# Altium schematic sheet Teensy_4.1_Section.SchDoc
size 420 x 297 mm; SheetNumber: 2; SheetTotal: 4
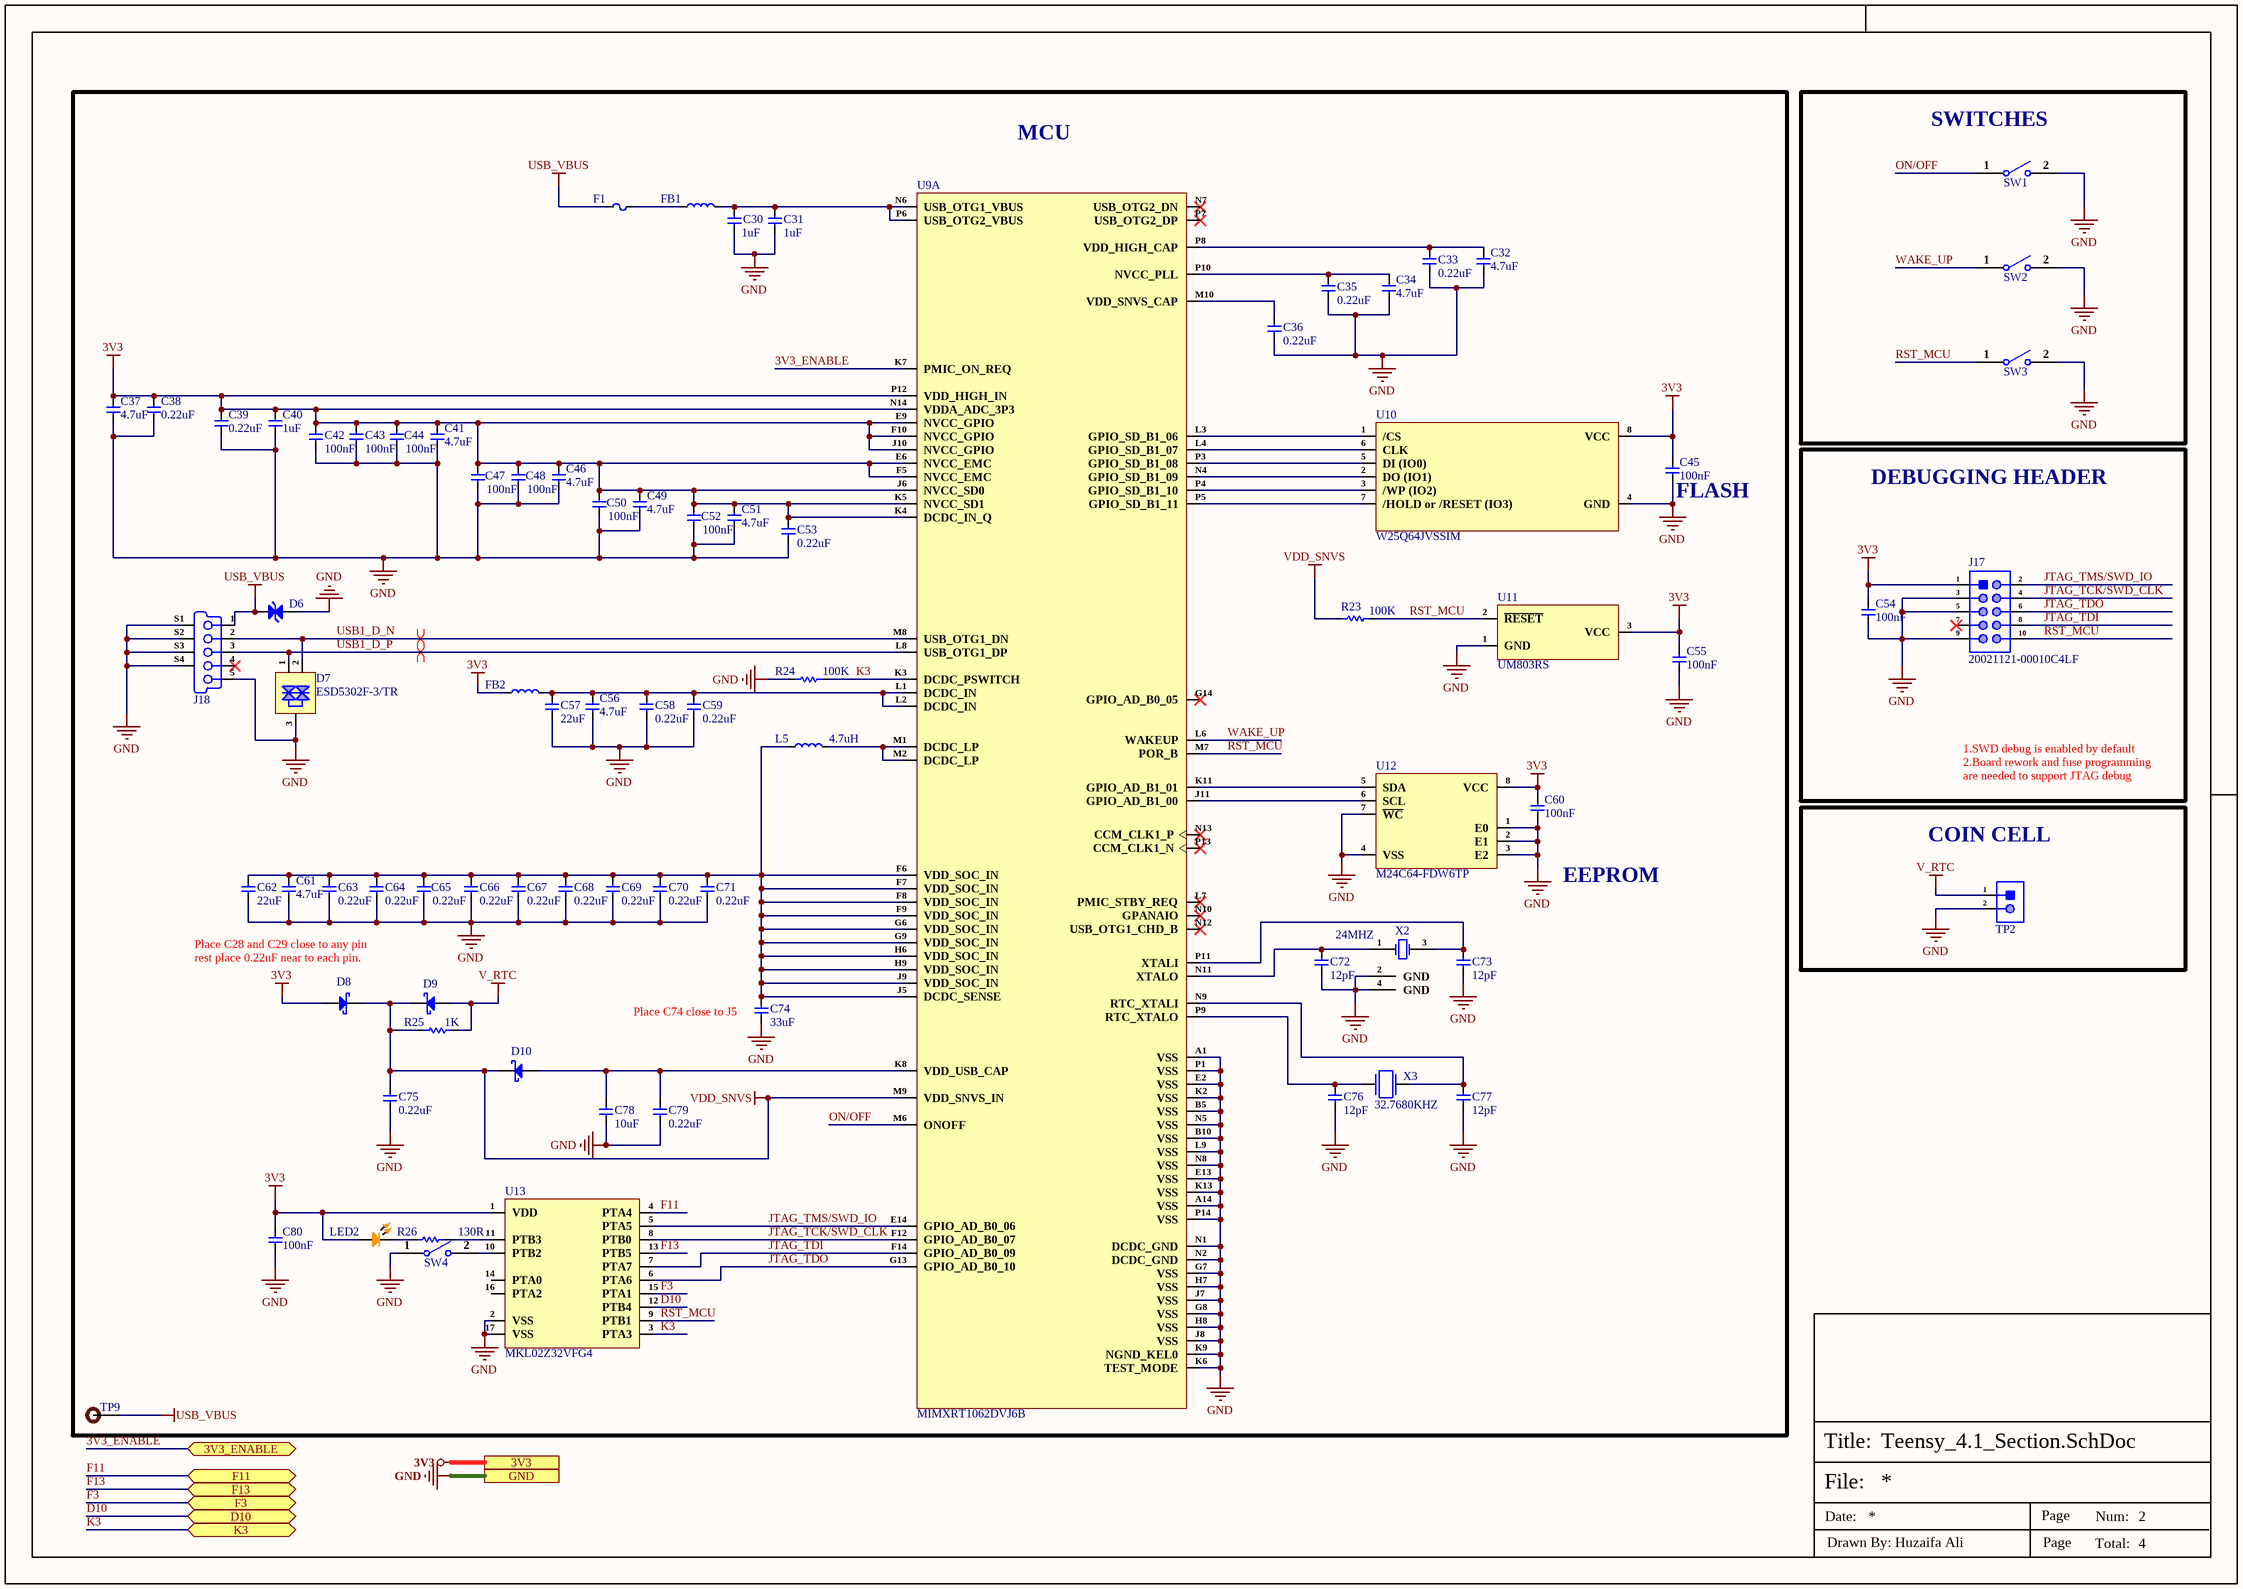
[diagram p0: Teensy_4.1_Section.SchDoc]

## Parts
C30  1uF  [Cap-0402]
C31  1uF  [Cap-0402]
C32  4.7uF  [Cap-0402]
C33  0.22uF  [Cap-0402]
C34  4.7uF  [Cap-0402]
C35  0.22uF  [Cap-0402]
C36  0.22uF  [Cap-0402]
C37  4.7uF  [Cap-0402]
C38  0.22uF  [Cap-0402]
C39  0.22uF  [Cap-0402]
C40  1uF  [Cap-0402]
C41  4.7uF  [Cap-0402]
C42  100nF  [cap-0402]
C43  100nF  [cap-0402]
C44  100nF  [cap-0402]
C45  100nF  [cap-0402]
C46  4.7uF  [Cap-0402]
C47  100nF  [cap-0402]
C48  100nF  [cap-0402]
C49  4.7uF  [Cap-0402]
C50  100nF  [cap-0402]
C51  4.7uF  [Cap-0402]
C52  100nF  [cap-0402]
C53  0.22uF  [Cap-0402]
C54  100nF  [cap-0402]
C55  100nF  [cap-0402]
C56  4.7uF  [Cap-0402]
C57  22uF  [Cap-0603]
C58  0.22uF  [Cap-0402]
C59  0.22uF  [Cap-0402]
C60  100nF  [cap-0402]
C61  4.7uF  [Cap-0402]
C62  22uF  [Cap-0603]
C63  0.22uF  [Cap-0402]
C64  0.22uF  [Cap-0402]
C65  0.22uF  [Cap-0402]
C66  0.22uF  [Cap-0402]
C67  0.22uF  [Cap-0402]
C68  0.22uF  [Cap-0402]
C69  0.22uF  [Cap-0402]
C70  0.22uF  [Cap-0402]
C71  0.22uF  [Cap-0402]
C72  12pF  [Cap-0402]
C73  12pF  [Cap-0402]
C74  33uF  [Cap-1206]
C75  0.22uF  [Cap-0402]
C76  12pF  [Cap-0402]
C77  12pF  [Cap-0402]
C78  10uF  [Cap-0603]
C79  0.22uF  [Cap-0402]
C80  100nF  [cap-0402]
D6  PESD5V0H1BSFYL  [DSN0603-2]  (value not drawn)
D7  ESD5302F-3/TR  [Sot-23]
D8  RB521S30T1G  [SOD-523]  (value not drawn)
D9  RB521S30T1G  [SOD-523]  (value not drawn)
D10  RB521S30T1G  [SOD-523]  (value not drawn)
F1  SMD0603-050  [Fuse-0603]  (value not drawn)
FB1  BLM15PD121SN1D  [IND-0402]  (value not drawn)
FB2  BLM15PD121SN1D  [IND-0402]  (value not drawn)
J17  20021121-00010C4LF  [20021121-00010C4LF_]
J18  HX MICRO XNJ JB  [HX MICRO XNJ JB]  (value not drawn)
L5  4.7uH  [IND-1210]
LED2  Orange  [LED-0805]  (value not drawn)
R23  100K  [Res-0402]
R24  100K  [Res-0402]
R25  1K  [Res-0603]
R26  130R  [Res-0603]
SW1  B3U-1000P  [B3U-1000P]  (value not drawn)
SW2  B3U-1000P  [B3U-1000P]  (value not drawn)
SW3  B3U-1000P  [B3U-1000P]  (value not drawn)
SW4  B3U-1000P  [B3U-1000P]  (value not drawn)
TP2  2 Test Pad  [2 Test Pad]  (value not drawn)  (no BOM)
TP9  TEST POINT  [Test-point]  (value not drawn)  (no BOM)
U9  MIMXRT1062DVJ6B  [196-LFBGA (12x12)]  (part A of 2)
U10  W25Q64JVSSIM  [SOIC-8 (208 mil)]
U11  UM803RS  [SOT-23]
U12  M24C64-FDW6TP  [8-TSSOP]
U13  MKL02Z32VFG4  [16-QFN (3x3).]
X2  24MHZ  [X322524MOB4SI-]
X3  32.7680KHZ  [NX3215SA-32.768K-STD-MUA-8_]

## Blocks framed on the sheet
SWITCHES: SW1-SW3
DEBUGGING HEADER: C54 J17
COIN CELL: TP2

## Ports
3V3 (see Top_Section[4B], Controller_Section[5D], Power_Section[1D]), 3V3_ENABLE (bidir, see Top_Section[4B], Power_Section[1D]), D10 (bidir, see Top_Section[4B], Controller_Section[4D]), F3 (bidir, see Top_Section[4B], Controller_Section[4D]), F11 (bidir, see Top_Section[4B], Controller_Section[4D]), F13 (bidir, see Top_Section[4B], Controller_Section[4D]), GND (see Top_Section[4B], Controller_Section[5D], Power_Section[1D]), K3 (bidir, see Top_Section[4B], Controller_Section[4D])

## Nets
3V3: C37.2 C38.2 C39.2 C40.2 C41.2 C42.2 C43.2 C44.2 C45.2 C46.2 C47.2 C48.2 C49.2 C50.2 C51.2 C52.2 C53.2 C54.2 C55.2 C60.2 C80.2 D8.1(A) FB2.1 J17.1 LED2.1 U9.E6(NVCC_EMC) U9.E9(NVCC_GPIO) U9.F5(NVCC_EMC) U9.F10(NVCC_GPIO) U9.J6(NVCC_SD0) U9.J10(NVCC_GPIO) U9.K4(DCDC_IN_Q) U9.K5(NVCC_SD1) U9.N14(VDDA_ADC_3P3) U9.P12(VDD_HIGH_IN) U10.8(VCC) U11.3(VCC) U12.8(VCC) U13.1(VDD) ; port 3V3
GND: C30.1 C31.1 C32.1 C33.1 C34.1 C35.1 C36.1 C37.1 C38.1 C39.1 C40.1 C41.1 C42.1 C43.1 C44.1 C45.1 C46.1 C47.1 C48.1 C49.1 C50.1 C51.1 C52.1 C53.1 C54.1 C55.1 C56.1 C57.1 C58.1 C59.1 C60.1 C61.1 C62.1 C63.1 C64.1 C65.1 C66.1 C67.1 C68.1 C69.1 C70.1 C71.1 C72.2 C73.2 C74.1 C75.1 C76.2 C77.2 C78.1 C79.1 C80.1 D6.1(A) D7.3(GND) J17.3 J17.5 J17.9 J18.5(GND) J18.S1(Shield) J18.S2(Shield) J18.S3(Shield) J18.S4(Shield) R24.1 SW1.2 SW2.2 SW3.2 SW4.1 TP2.2 U9.A1(VSS) U9.A14(VSS) U9.B5(VSS) U9.B10(VSS) U9.E2(VSS) U9.E13(VSS) U9.G7(VSS) U9.G8(VSS) U9.H7(VSS) U9.H8(VSS) U9.J7(VSS) U9.J8(VSS) U9.K2(VSS) U9.K6(TEST_MODE) U9.K9(NGND_KEL0) U9.K13(VSS) U9.L9(VSS) U9.N1(DCDC_GND) U9.N2(DCDC_GND) U9.N5(VSS) U9.N8(VSS) U9.P1(VSS) U9.P14(VSS) U10.4(GND) U11.1(GND) U12.1(E0) U12.2(E1) U12.3(E2) U12.4(VSS) U12.7(~{WC}) U13.2(VSS) U13.17(VSS) X2.2(GND) X2.4(GND) ; port GND
USB_VBUS: D6.2(A) F1.1 J18.1(V_BUS_(5V)) TP9.1
V_RTC: D9.1(A) R25.1 TP2.1
VDD_SNVS: C75.2 D8.2(K) D9.2(K) D10.2(K) R23.1 R25.2 U9.M9(VDD_SNVS_IN)
3V3_ENABLE: U9.K7(PMIC_ON_REQ) ; port 3V3_ENABLE
D10: U13.12(PTB4) ; port D10
F3: U13.15(PTA1) ; port F3
F11: U13.4(PTA4) ; port F11
F13: U13.13(PTB5) ; port F13
JTAG_TCK/SWD_CLK: J17.4 U9.F12(GPIO_AD_B0_07) U13.8(PTB0)
JTAG_TDI: J17.8 U9.F14(GPIO_AD_B0_09) U13.7(PTA7)
JTAG_TDO: J17.6 U9.G13(GPIO_AD_B0_10) U13.6(PTA6)
JTAG_TMS/SWD_IO: J17.2 U9.E14(GPIO_AD_B0_06) U13.5(PTA5)
K3: R24.2 U9.K3(DCDC_PSWITCH) U13.3(PTA3) ; port K3
ON/OFF: SW1.1 U9.M6(ONOFF)
RST_MCU: J17.10 R23.2 SW3.1 U9.M7(POR_B) U11.2(~{RESET}) U13.9(PTB1)
USB1_D_N: D7.2(I/O2) J18.2(D-) U9.M8(USB_OTG1_DN)
USB1_D_P: D7.1(I/O1) J18.3(D+) U9.L8(USB_OTG1_DP)
WAKE_UP: SW2.1 U9.L6(WAKEUP)
NetC30_2: C30.2 C31.2 FB1.2 U9.N6(USB_OTG1_VBUS) U9.P6(USB_OTG2_VBUS)
NetC32_2: C32.2 C33.2 U9.P8(VDD_HIGH_CAP)
NetC34_2: C34.2 C35.2 U9.P10(NVCC_PLL)
NetC36_2: C36.2 U9.M10(VDD_SNVS_CAP)
NetC56_2: C56.2 C57.2 C58.2 C59.2 FB2.2 U9.L1(DCDC_IN) U9.L2(DCDC_IN)
NetC61_2: C61.2 C62.2 C63.2 C64.2 C65.2 C66.2 C67.2 C68.2 C69.2 C70.2 C71.2 C74.2 L5.1 U9.F6(VDD_SOC_IN) U9.F7(VDD_SOC_IN) U9.F8(VDD_SOC_IN) U9.F9(VDD_SOC_IN) U9.G6(VDD_SOC_IN) U9.G9(VDD_SOC_IN) U9.H6(VDD_SOC_IN) U9.H9(VDD_SOC_IN) U9.J5(DCDC_SENSE) U9.J9(VDD_SOC_IN)
NetC72_1: C72.1 U9.N11(XTALO) X2.1(CRYSTAL)
NetC73_1: C73.1 U9.P11(XTALI) X2.3(CRYSTAL)
NetC76_1: C76.1 U9.P9(RTC_XTALO) X3.2
NetC77_1: C77.1 U9.N9(RTC_XTALI) X3.1
NetC78_2: C78.2 C79.2 D10.1(A) U9.K8(VDD_USB_CAP)
NetF1_2: F1.2 FB1.1
NetL5_2: L5.2 U9.M1(DCDC_LP) U9.M2(DCDC_LP)
NetLED2_2: LED2.2 R26.2
NetR26_1: R26.1 U13.11(PTB3)
NetSW4_2: SW4.2 U13.10(PTB2)
NetU9_J11: U9.J11(GPIO_AD_B1_00) U12.6(SCL)
NetU9_K11: U9.K11(GPIO_AD_B1_01) U12.5(SDA)
NetU9_L3: U9.L3(GPIO_SD_B1_06) U10.1(/CS)
NetU9_L4: U9.L4(GPIO_SD_B1_07) U10.6(CLK)
NetU9_N4: U9.N4(GPIO_SD_B1_09) U10.2(DO_(IO1))
NetU9_P3: U9.P3(GPIO_SD_B1_08) U10.5(DI_(IO0))
NetU9_P4: U9.P4(GPIO_SD_B1_10) U10.3(/WP_(IO2))
NetU9_P5: U9.P5(GPIO_SD_B1_11) U10.7(/HOLD_or_/RESET_(IO3))

Not connected (* = marked no-connect by the designer): J17 7*; J18 4(ID)*; U9 G14(GPIO_AD_B0_05)* L7(PMIC_STBY_REQ)* N7(USB_OTG2_DN)* N10(GPANAIO)* N12(USB_OTG1_CHD_B)* N13(CCM_CLK1_P)* P7(USB_OTG2_DP)* P13(CCM_CLK1_N)*; U13 14(PTA0) 16(PTA2)

## Layout directives
differential pair; net class USB_PROGRAM; differential pair class USB_PROGRAM_Lines; rule Impedance Constraint [Min = 85.00    Max = 90.00    ]; rule Matched Net Lengths [Tolerance = 50mil]: USB1_D_N, USB1_D_P

## Notes on the sheet
- MCU
- (near C45) FLASH
- 1.SWD debug is enabled by default
  2.Board rework and fuse programming
  are needed to support JTAG debug
- EEPROM
- Place C28 and C29 close to any pin rest place 0.22uF near to each pin.
- (near C74) Place C74 close to J5
- File:
- Title:
- Date:
- Page
- Num:
- Total:
- Drawn By: Huzaifa Ali

## Library data of the parts
C30 C31 C40 = CC0402KRX5R7BB105: CAP CER 1UF 16V X5R 0402; Manufacturer: Yageo; Tolerance: 10%; Item Type: Capacitor; Supplier 1: Digi-Key; Manufacturer Part Number: CC0402KRX5R7BB105; Stock 1: 1405667; Pricing 1: 1=0.36, 10=0.252, 100=0.1512, 500=0.1134, 1000=0.09576, 2500=0.09072, 5000=0.08568 (USD); Mount: Surface Mount; Case/Package: 0402; Weight: 2.3E-05oz; Case Code (Imperial): 0402; Case Code (Metric): 1005; Min Operating Temperature: -55°C; Max Operating Temperature: 85°C; Capacitance: 1uF; Dielectric: X5R; Packaging: Tape and Reel; Voltage Rating (DC): 16V; Voltage Rating: 16V; Termination: SMD/SMT; Composition: Ceramic; Length: 1mm; Height: 0.5mm; Width: 0.02inch; Thickness: 0.022inch; Depth: 0.5mm; Radiation Hardening: No; Lead Free: Lead Free; Halogen Free: Halogen Free; ComponentLink1URL: http://www.yageo.com/documents/recent/UPY-GPHC_X5R_4V-to-50V_12.pdf?src-supplier=Avnet+Europe; ComponentLink1Description: http://www.yageo.com/documents/recent/UPY-GPHC_X5R_4V-to-50V_12.pdf?src-supplier=Avnet+Europe; Supplier Part Number 1: 311-1691-6-ND; LCSC Part Number: C325464
C32 C34 C37 C41 C46 C49 C51 C56 C61 = CGA0402X5R475M250GT: 25V 4.7uF X5R ±20% 0402 Multilayer Ceramic Capacitors MLCC - SMD/SMT ROHS; Manufacturer: HRE; ComponentLink1Description: LCSC; ComponentLink1URL: https://www.lcsc.com/product-detail/Multilayer-Ceramic-Capacitors-MLCC-SMD-SMT_HRE-CGA0402X5R475M250GT_C6119795.html; Manufacturer Part Number: CGA0402X5R475M250GT; Footprint: 0402; Value: 4.7uF; LCSC Part Number: C6119795; Item Type: Capacitor
C33 C35 C36 C38 C39 C53 C58 C59 C63-C71 C75 C79 = CC0402KRX5R8BB224: CAP CER 0.22UF 25V X5R 0402; Manufacturer: Yageo; Capacitance: 220nF; Tolerance: 10%; Supplier 1: Mouser; Manufacturer Part Number: CC0402KRX5R8BB224; RoHS: Yes; Category: Ceramic Capacitors; Stock 1: 61266; Pricing 1: 1=0.10000, 10=0.03300, 50=0.03300, 100=0.02700, 1000=0.01500, 10000=0.01300 (USD); Mount: Surface Mount; Case/Package: 0402; Min Operating Temperature: -55°C; Max Operating Temperature: 85°C; Packaging: Tape and Reel; Voltage Rating: 25V; Voltage Rating (DC): 25V; Dielectric: X5R; Length: 0.039inch; Width: 0.02inch; Thickness: 0.022inch; Lead Free: Lead Free; Halogen Free: Halogen Free; RoHS Compliant: Yes; ComponentLink1URL: http://www.yageo.com/documents/recent/UPY-GPHC_X5R_4V-to-50V_25.pdf?src-supplier=Digi-Key; ComponentLink1Description: http://www.yageo.com/documents/recent/UPY-GPHC_X5R_4V-to-50V_25.pdf?src-supplier=Digi-Key; ComponentLink2URL: https://www.yageo.com/upload/media/product/productsearch/datasheet/mlcc/UPY-GPHC_X5R_4V-to-50V_26.pdf?src-supplier=Digi-Key; ComponentLink2Description: https://www.yageo.com/upload/media/product/productsearch/datasheet/mlcc/UPY-GPHC_X5R_4V-to-50V_26.pdf?src-supplier=Digi-Key; ComponentLink3URL: http://www.yageo.com/documents/recent/UPY-GPHC_X5R_4V-to-50V_23.pdf?src-supplier=Digi-Key; ComponentLink3Description: http://www.yageo.com/documents/recent/UPY-GPHC_X5R_4V-to-50V_23.pdf?src-supplier=Digi-Key; Supplier Part Number 1: 603-CC402KRX5R8BB224; LCSC Part Number: C326836
C42-C45 C47 C48 C50 C52 C54 C55 C60 C80 = C1005X7R1H104KT000F: CAP CER 0.1UF 50V X7R 0402; Manufacturer: TDK; Tolerance: 10%; Voltage: 25V; Item Type: Capacitor; Supplier 1: Avnet; Manufacturer Part Number: C1005X7R1H104KT000F; RoHS: No; Category: Ceramic Capacitors; Dielectric: X7R; Supplier Part Number 1: C1005X7R1H104KT000F; LCSC Part Number: C361198; ComponentLink1Description: LCSC; ComponentLink1URL: https://www.lcsc.com/product-detail/Multilayer-Ceramic-Capacitors-MLCC-SMD-SMT_TDK-C1005X7R1H104KT000F_C361198.html
C57 C62 = CC0603MRX5R6BB226: CAP CER 22UF 10V X5R 0603; Manufacturer: Yageo; Tolerance: 20%; Item Type: Capacitor; Supplier 1: Digi-Key; Manufacturer Part Number: CC0603MRX5R6BB226; RoHS: Yes; Category: Ceramic Capacitors; Stock 1: 19628; Pricing 1: 1=0.68000, 10=0.48000, 50=0.36300, 100=0.31610, 500=0.23416, 1000=0.19903 (USD); Mount: Surface Mount; Case/Package: 0603; Case Code (Metric): 1608; Case Code (Imperial): 0603; Weight: 7.1E-05oz; Min Operating Temperature: -55°C; Max Operating Temperature: 85°C; Packaging: Tape and Reel; Capacitance: 22uF; Voltage Rating: 10V; Dielectric: X5R; Termination: SMD/SMT; Voltage Rating (DC): 10V; Package Quantity: 4000; Length: 0.063inch; Width: 0.8mm; Height: 0.8mm; Thickness: 0.035inch; Lead Free: Lead Free; Halogen Free: Halogen Free; RoHS Compliant: Yes; ComponentLink1URL: http://www.mouser.com/ds/2/447/Yageo_UPY-GP_NP0_16V-to-50V_9-358835.pdf?src-supplier=Mouser; ComponentLink1Description: http://www.mouser.com/ds/2/447/Yageo_UPY-GP_NP0_16V-to-50V_9-358835.pdf?src-supplier=Mouser; ComponentLink2URL: http://www.yageo.com/documents/recent/UPY-GPHC_X5R_4V-to-50V_25.pdf?src-supplier=Digi-Key; ComponentLink2Description: http://www.yageo.com/documents/recent/UPY-GPHC_X5R_4V-to-50V_25.pdf?src-supplier=Digi-Key; Supplier Part Number 1: 311-1819-1-ND; LCSC Part Number: C109447
C72 C73 C76 C77 = GJM1555C1H120GB01D: CAP CER 12PF 50V C0G/NP0 0402; Manufacturer: Murata; Tolerance: 2%; Dielectric: C0G; Supplier 1: Digi-Key; Manufacturer Part Number: GJM1555C1H120GB01D; RoHS: Yes; Category: Ceramic Capacitors; Stock 1: 266975; Pricing 1: 1=0.18000, 10=0.12600, 50=0.07560, 100=0.06390, 500=0.04370, 1000=0.03865, 2500=0.03698, 5000=0.03361 (USD); Mount: Surface Mount; Case/Package: 0402; Case Code (Imperial): 0402; Case Code (Metric): 1005; Min Operating Temperature: -55°C; Max Operating Temperature: 125°C; Capacitance: 12pF; Voltage Rating: 50V; Voltage Rating (DC): 50V; Packaging: Tape and Reel; Package Quantity: 10000; Termination: SMD/SMT; Series: GJM; Construction: Flat; Length: 1mm; Width: 0.5mm; Height: 0.5mm; Thickness: 0.022inch; Depth: 0.5mm; Radiation Hardening: No; Lead Free: Lead Free; RoHS Compliant: Yes; ComponentLink1URL: https://datasheet.ciiva.com/11608/product-11608208.pdf?src-supplier=Avnet; ComponentLink1Description: https://datasheet.ciiva.com/11608/product-11608208.pdf?src-supplier=Avnet; ComponentLink2URL: https://datasheet.ciiva.com/29542/partnumbering-e-01-29542716.pdf?src-supplier=Digi-Key; ComponentLink2Description: https://datasheet.ciiva.com/29542/partnumbering-e-01-29542716.pdf?src-supplier=Digi-Key; ComponentLink3URL: https://datasheet.ciiva.com/29542/partnumbering-e-01-29542715.pdf?src-supplier=Digi-Key; ComponentLink3Description: https://datasheet.ciiva.com/29542/partnumbering-e-01-29542715.pdf?src-supplier=Digi-Key; ComponentLink4URL: https://datasheet.ciiva.com/29542/partnumbering-e-01-29542717.pdf?src-supplier=Digi-Key; ComponentLink4Description: https://datasheet.ciiva.com/29542/partnumbering-e-01-29542717.pdf?src-supplier=Digi-Key; Supplier Part Number 1: 490-8078-1-ND; LCSC Part Number: C161305
C74 = C3216X5R1A336MTJ00N: 10V 33uF X5R ±20% 1206 ROHS; Manufacturer: TDK; Item Type: Capacitor; ComponentLink1URL: https://datasheet.ciiva.com/24216/c3216x5r1a336m160ab-264972-24216176.pdf?src-supplier=Mouser; ComponentLink1Description: https://datasheet.ciiva.com/24216/c3216x5r1a336m160ab-264972-24216176.pdf?src-supplier=Mouser; ComponentLink2URL: https://datasheet.ciiva.com/16482/mlccspec-commercial-general-midvoltage-en-16482550.pdf?src-supplier=Future+Electronics; ComponentLink2Description: https://datasheet.ciiva.com/16482/mlccspec-commercial-general-midvoltage-en-16482550.pdf?src-supplier=Future+Electronics; ComponentLink3URL: https://datasheet.ciiva.com/6253/tdkmlcccaprange-6253132.pdf?src-supplier=Digi-Key; ComponentLink3Description: https://datasheet.ciiva.com/6253/tdkmlcccaprange-6253132.pdf?src-supplier=Digi-Key; ComponentLink4URL: https://datasheet.ciiva.com/6253/tdkmlcccaprange-6253134.pdf?src-supplier=Digi-Key; ComponentLink4Description: https://datasheet.ciiva.com/6253/tdkmlcccaprange-6253134.pdf?src-supplier=Digi-Key; LCSC Part Number: C342606; Manufacturer Part Number: C3216X5R1A336MTJ00N; Package: 1206
C78 = CL10A106MA8NRNC: CAP CER 10UF 25V X5R 0603; Manufacturer: Samsung; Tolerance: 20%; Supplier 1: Avnet; Manufacturer Part Number: CL10A106MA8NRNC; RoHS: Yes; Category: Ceramic Capacitors; Pricing 1: 4000=0.03753, 8000=0.03700, 16000=0.03595, 24000=0.03515, 32000=0.03383, 40000=0.03304, 400000=0.03225 (USD); Mount: Surface Mount; Case/Package: 0603; Case Code (Metric): 1608; Case Code (Imperial): 0603; Contact Plating: Tin; Min Operating Temperature: -55°C; Max Operating Temperature: 85°C; Package Quantity: 1; Packaging: Tape and Reel; Capacitance: 10uF; Voltage Rating: 25V; Dielectric: X5R; Termination: Wraparound; Series: CL; Construction: Flat; Length: 0.063inch; Width: 0.031inch; Thickness: 0.035inch; Lead Free: Lead Free; RoHS Compliant: Yes; ComponentLink1URL: https://datasheet.ciiva.com/25766/cl10a106ma8nrnc-25766562.pdf?src-supplier=Digi-Key; ComponentLink1Description: https://datasheet.ciiva.com/25766/cl10a106ma8nrnc-25766562.pdf?src-supplier=Digi-Key; Supplier Part Number 1: CL10A106MA8NRNC; LCSC Part Number: C96446
D6 = PESD5V0H1BSFYL: TVS DIODE 5VWM 6.3VC DSN0603-2; Manufacturer: Nexperia; Supplier 1: Avnet; Manufacturer Part Number: PESD5V0H1BSFYL; RoHS: Yes; Category: ESD and Circuit Protection ICs; Stock 1: 9000; Pricing 1: 18000=0.06453, 36000=0.06278, 54000=0.06104, 90000=0.05930, 180000=0.05755, 900000=0.05581, 1800000=0.05406 (USD); RoHS Compliant: Yes; ComponentLink1URL: http://www.farnell.com/datasheets/1961312.pdf?src-supplier=Farnell; ComponentLink1Description: http://www.farnell.com/datasheets/1961312.pdf?src-supplier=Farnell; ComponentLink2URL: https://assets.nexperia.com/documents/data-sheet/PESD5V0H1BSF.pdf?src-supplier=Digi-Key; ComponentLink2Description: https://assets.nexperia.com/documents/data-sheet/PESD5V0H1BSF.pdf?src-supplier=Digi-Key; ComponentLink3URL: http://www.farnell.com/datasheets/1961312.pdf?src-supplier=Newark; ComponentLink3Description: http://www.farnell.com/datasheets/1961312.pdf?src-supplier=Newark; Supplier Part Number 1: PESD5V0H1BSFYL; LCSC Part Number: C477989; Item Type: Diode
D7 = ESD5302F-3/TR: 16A 20V 7V 5V@Max Unidirectional SOT-23 TVS ROHS; Manufacturer: WILLSEMI; Item Type: Diode; Manufacturer Part Number: ESD5302F-3/TR; Package: SOT-23; LCSC Part Number: C239643; ComponentLink1Description: LCSC; ComponentLink1URL: https://www.lcsc.com/product-detail/TVS_WILLSEMI-Will-Semicon-ESD5302F-3-TR_C239643.html
D8-D10 = RB521S30T1G: DIODE SCHOTTKY 30V 200MA SOD523; Manufacturer: ON Semiconductor; Element Configuration: Single; Max Surge Current: 1A; Max Reverse Current: 30uA; Forward Voltage: 500mV; Power Dissipation: 200mW; Polarity: Standard; Supplier: Future Electronics; Supplier Part Number: 4067781; Manufacturer Part Number: RB521S30T1G; RoHS: Yes; Category: Rectifier Diodes; Stock: 156000; Pricing: 3000=0.0165, 12000=0.0158, 45000=0.0151, 90000=0.0148, 225000=0.0141 (USD); Case/Package: SOD-523-2; Pins: 2; Min Operating Temperature: -55°C; Max Operating Temperature: 125°C; Forward Current: 200mA; Max Repetitive Reverse Voltage (Vrrm): 30V; Package Quantity: 1; Packaging: Tape and Reel; Average Rectified Current: 200mA; Max Reverse Leakage Current: 30uA; Peak Non-Repetitive Surge Current: 1A; Max Forward Surge Current (Ifsm): 1A; Voltage Rating (DC): 30V; Current Rating: 200mA; Output Current: 200mA; Max Reverse Voltage (DC): 30V; Series: -; Length: 1.3mm; Width: 0.9mm; Height: 0.7mm; Radiation Hardening: No; RoHS Compliant: Yes; Reach SVHC Compliant: No; Lead Free: Lead Free; ComponentLink1URL: http://www.farnell.com/datasheets/2354099.pdf?src-supplier=Newark; ComponentLink1Description: http://www.farnell.com/datasheets/2354099.pdf?src-supplier=Newark; LCSC Part Number: C145179; Item Type: Diode
F1 = SMD0603-050: 6V 500mA 40A 1A 0603 Resettable Fuses ROHS; Manufacturer: TECHFUSE; Item Type: Fuse; Supplier 1: LCSC; Manufacturer Part Number: SMD0603-050; RoHS: No; Category: Uncategorized; Supplier Part Number 1: C69679; LCSC Part Number: C69679; ComponentLink1Description: LCSC; ComponentLink1URL: https://www.lcsc.com/product-detail/Resettable-Fuses_TECHFUSE-SMD0603-050_C69679.html
FB1 FB2 = BLM15PD121SN1D: FERRITE BEAD 120 OHM 0402 1LN; Manufacturer: Murata; Material: Steel,Ferrite; Tolerance: 25%; Impedance: 120R; Current Rating: 1.3A; Number of Lines: 1; DC Resistance (DCR): 90mR; Test Frequency: 100MHz; Supplier 1: Avnet; Manufacturer Part Number: BLM15PD121SN1D; RoHS: Yes; Category: Ferrite Beads and Chips; Stock 1: 300000; Pricing 1: 10000=0.03238, 20000=0.03063, 40000=0.02888, 60000=0.02713, 80000=0.02538, 100000=0.02363, 1000000=0.02188 (USD); Case/Package: 0402; Number of Pins: 2; Core Material: Ferrite; Case Code (Metric): 1005; Case Code (Imperial): 0402; Min Operating Temperature: -55°C; Max Operating Temperature: 125°C; Package Quantity: 1; Packaging: Tape and Reel; Max Current Rating: 1.3A; Termination: SMD/SMT; Max DC Current: 1.3A; DC Current: 1.3A; Number of Circuits: 1; Series: BLM15PD; DC Resistance-Max: 90mR; Length: 1mm; Width: 0.5mm; Height: 0.5mm; Depth: 0.55mm; Radiation Hardening: No; Reach SVHC Compliant: Yes; Military Standard: Not; Lead Free: Lead Free; RoHS Compliant: Yes; ComponentLink1URL: https://datasheet.ciiva.com/11800/0900766b811b5866-11800860.pdf?src-supplier=RSComponents; ComponentLink1Description: https://datasheet.ciiva.com/11800/0900766b811b5866-11800860.pdf?src-supplier=RSComponents; ComponentLink2URL: https://datasheet.ciiva.com/18093/getdatasheetpartid-195858-18093157.pdf?src-supplier=Verical; ComponentLink2Description: https://datasheet.ciiva.com/18093/getdatasheetpartid-195858-18093157.pdf?src-supplier=Verical; ComponentLink3URL: https://datasheet.ciiva.com/41425/001171686-da-01-en-chip-drossel0402-120r-1300ma-1-0x0-5mm-41425776.pdf?src-supplier=Conrad; ComponentLink3Description: https://datasheet.ciiva.com/41425/001171686-da-01-en-chip-drossel0402-120r-1300ma-1-0x0-5mm-41425776.pdf?src-supplier=Conrad; ComponentLink4URL: https://datasheet.ciiva.com/41449/001172205-da-01-en-drossel-0402-120r-11-0x0-5mm-10000st-41449495.pdf?src-supplier=Conrad; ComponentLink4Description: https://datasheet.ciiva.com/41449/001172205-da-01-en-drossel-0402-120r-11-0x0-5mm-10000st-41449495.pdf?src-supplier=Conrad; ComponentLink5URL: https://datasheet.ciiva.com/1012/l0110e-1012435.pdf?src-supplier=Digi-Key; ComponentLink5Description: https://datasheet.ciiva.com/1012/l0110e-1012435.pdf?src-supplier=Digi-Key; ComponentLink6URL: https://datasheet.ciiva.com/1012/l0110e-1012434.pdf?src-supplier=Digi-Key; ComponentLink6Description: https://datasheet.ciiva.com/1012/l0110e-1012434.pdf?src-supplier=Digi-Key; ComponentLink7URL: https://datasheet.ciiva.com/1012/l0110e-1012436.pdf?src-supplier=Digi-Key; ComponentLink7Description: https://datasheet.ciiva.com/1012/l0110e-1012436.pdf?src-supplier=Digi-Key; Supplier Part Number 1: BLM15PD121SN1D; LCSC Part Number: C76891; Item Type: Ferrite Bead
J17 = 20021121-00010C4LF: CONN HEADER SMD 10POS 1.27MM; Manufacturer: Amphenol FCI; Number of Contacts: 10; Contact Resistance: 30mR; Current Rating: 1A; Voltage Rating: 125V; Insulation Resistance: 100MR; Gender: Male; Connector Type: Male Pin,Header; Row Spacing: 0.05inch; Stack Height: 3mm; Item Type: Jtag Male Header; Supplier 1: Digi-Key; Manufacturer Part Number: 20021121-00010C4LF; Stock 1: 0; Pricing 1: 1=0.87, 10=0.761, 100=0.6563 (USD); Mount: Surface Mount; Contact Plating: Gold; Contact Material: Copper Alloy,Copper,Gold; Color: Black; Housing Color: Black; Housing Material: Thermoplastic; Min Operating Temperature: -40°C; Max Operating Temperature: 85°C; Number of Rows: 2; Termination: Solder; Packaging: Tape and Reel; Package Quantity: 600; Number of Positions: 10; Max Voltage Rating (AC): 125V; Orientation: Straight; Length: 6.35mm; Pitch: 1.27mm; Contact Mating Length: 0.12inch; Depth: 3.4mm; Radiation Hardening: No; REACH SVHC: No SVHC; ComponentLink1URL: https://www.verical.com/server-webapp/html/getDatasheet?partID=177140&src-supplier=Verical; ComponentLink1Description: https://www.verical.com/server-webapp/html/getDatasheet?partID=177140&src-supplier=Verical; ComponentLink2URL: http://portal.fciconnect.com/Comergent/fci/drawing/20021121.pdf?src-supplier=Avnet; ComponentLink2Description: http://portal.fciconnect.com/Comergent/fci/drawing/20021121.pdf?src-supplier=Avnet; ComponentLink3URL: https://cdn.amphenol-icc.com/media/wysiwyg/files/drawing/20021121.pdf?src-supplier=Digi-Key; ComponentLink3Description: https://cdn.amphenol-icc.com/media/wysiwyg/files/drawing/20021121.pdf?src-supplier=Digi-Key; ComponentLink4URL: http://portal.fciconnect.com/Comergent/fci/drawing/20021121.pdf?src-supplier=Avnet+Europe; ComponentLink4Description: http://portal.fciconnect.com/Comergent/fci/drawing/20021121.pdf?src-supplier=Avnet+Europe; ComponentLink5URL: https://media.digikey.com/pdf/Data%20Sheets/FCI%20PDFs/Minitek%20127_Catalog.pdf?src-supplier=Digi-Key; ComponentLink5Description: https://media.digikey.com/pdf/Data%20Sheets/FCI%20PDFs/Minitek%20127_Catalog.pdf?src-supplier=Digi-Key; ComponentLink6URL: http://portal.fciconnect.com/Comergent//fci/drawing/20021121.pdf?src-supplier=Mouser; ComponentLink6Description: http://portal.fciconnect.com/Comergent//fci/drawing/20021121.pdf?src-supplier=Mouser; Supplier Part Number 1: 609-3695-6-ND; LCSC Part Number: C150517
J18 = HX MICRO XNJ JB: Female Micro-B SMD USB Connectors ROHS; Manufacturer: HANXIA; Item Type: Micro-B Connector; Manufacturer Part Number: HX MICRO XNJ JB; Package: Custom; LCSC Part Number: C5160305; ComponentLink1Description: LCSC; ComponentLink1URL: https://www.lcsc.com/product-detail/USB-Connectors_hanxia-HX-MICRO-XNJ-JB_C5160305.html
L5 = DFE322512F-4R7M=P2: FIXED IND 4.7UH 1.6A 157MOHM SMD; Manufacturer: Murata; Item Type: Inductor; Supplier 1: Digi-Key; Manufacturer Part Number: DFE322512F-4R7M=P2; RoHS: Yes; Category: Fixed Inductors; Stock 1: 4687; Pricing 1: 1=0.61, 10=0.533, 25=0.4952, 50=0.4188, 100=0.3808, 250=0.35792, 500=0.31984, 1000=0.25892 (USD); RoHS Compliant: Yes; Supplier Part Number 1: 490-DFE322512F-4R7M=P2CT-ND; LCSC Part Number: C703083
LED2 = XL-2012UOC: Colorless transparence -30℃~+85℃ 601nm~603nm Positive post Orange 120° 55mW 0805 Light Emitting Diodes (LED) ROHS; Manufacturer: XINGLIGHT; Manufacture Part No: XL-2012UOC; Package: 0805; LCSC Part no: C965813
R23 R24 = RC0402FR-07100KL: RES 100K OHM 1% 1/16W 0402; Manufacturer: Yageo; Resistance: 100kR; Temperature Coefficient: 100ppm/°C; Power Rating: 63mW; Voltage Rating: 50V; Item Type: Resistor; Supplier 1: Mouser; Manufacturer Part Number: RC0402FR-07100KL; RoHS: Yes; Category: Chip SMD Resistors; Stock 1: 7759549; Pricing 1: 1=0.10000, 10=0.01200, 50=0.01200, 100=0.00500, 1000=0.00300, 2500=0.00200, 10000=0.00100 (USD); Case/Package: 0402; Case Code (Metric): 1005; Case Code (Imperial): 0402; Min Operating Temperature: -55°C; Max Operating Temperature: 155°C; Resistor Type: Thick Film; Tolerance: 1%; Packaging: Tape and Reel; Package Quantity: 1; Number of Terminations: 2; Termination: SMD/SMT; Max Power Dissipation: 63mW; Working Voltage: 50V; Features: Moisture Resistant; Series: RC; Resistance Tolerance: 1%; Construction: Rectangular; Technology: THICK FILM; Length: 0.039inch; Width: 0.02inch; Height: 0.016inch; Depth: 0.5mm; REACH SVHC: No SVHC; Lead Free: Lead Free; RoHS Compliant: Yes; Military Standard: Not; ComponentLink1URL: https://datasheet.ciiva.com/11819/0900766b80c66297-11819452.pdf?src-supplier=RSComponents; ComponentLink1Description: https://datasheet.ciiva.com/11819/0900766b80c66297-11819452.pdf?src-supplier=RSComponents; ComponentLink2URL: https://datasheet.ciiva.com/22747/1018594-22747509.pdf?src-supplier=Element14; ComponentLink2Description: https://datasheet.ciiva.com/22747/1018594-22747509.pdf?src-supplier=Element14; ComponentLink3URL: https://datasheet.ciiva.com/2453/pyu-r-int-thick-7-2453362.pdf?src-supplier=Digi-Key; ComponentLink3Description: https://datasheet.ciiva.com/2453/pyu-r-int-thick-7-2453362.pdf?src-supplier=Digi-Key; ComponentLink4URL: https://datasheet.ciiva.com/2453/pyu-r-int-thick-7-2453363.pdf?src-supplier=Digi-Key; ComponentLink4Description: https://datasheet.ciiva.com/2453/pyu-r-int-thick-7-2453363.pdf?src-supplier=Digi-Key; ComponentLink5URL: https://datasheet.ciiva.com/2453/pyu-r-int-thick-7-2453361.pdf?src-supplier=Digi-Key; ComponentLink5Description: https://datasheet.ciiva.com/2453/pyu-r-int-thick-7-2453361.pdf?src-supplier=Digi-Key; ComponentLink6URL: https://datasheet.ciiva.com/12667/pyu-rc0402-51-rohs-l-6-r-12667930.pdf?src-supplier=Mouser; ComponentLink6Description: https://datasheet.ciiva.com/12667/pyu-rc0402-51-rohs-l-6-r-12667930.pdf?src-supplier=Mouser; ComponentLink7URL: https://datasheet.ciiva.com/15189/getdatasheetpartid-323696-15189334.pdf?src-supplier=Verical; ComponentLink7Description: https://datasheet.ciiva.com/15189/getdatasheetpartid-323696-15189334.pdf?src-supplier=Verical; Supplier Part Number 1: 603-RC0402FR-07100KL; LCSC Part Number: C60491
R25 = RC0603FR-071KL: RES SMD 1K OHM 1% 1/10W 0603; Manufacturer: Yageo; Resistance: 1kR; Temperature Coefficient: 100ppm/°C; Power Rating: 100mW; Voltage Rating: 50V; Item type: Resistor; ComponentLink1URL: https://www.verical.com/server-webapp/html/getDatasheet?partID=409289&src-supplier=Verical; ComponentLink1Description: https://www.verical.com/server-webapp/html/getDatasheet?partID=409289&src-supplier=Verical; Supplier 1: Digi-Key; Manufacturer Part Number: RC0603FR-071KL; Stock 1: 21472395; Pricing 1: 1=0.1, 10=0.023, 100=0.0094, 1000=0.0042, 2500=0.0037 (USD); Case/Package: 0603; Contact Plating: Tin,Matte; Case Code (Imperial): 0603; Case Code (Metric): 1608; Min Operating Temperature: -55°C; Max Operating Temperature: 155°C; Tolerance: 1%; Composition: Thick Film; Packaging: Tape and Reel; Termination: SMD/SMT; Military Standard: Not; Length: 1.6mm; Height: 0.45mm; Depth: 0.8mm; Radiation Hardening: No; REACH SVHC: No SVHC; Lead Free: Lead Free; ComponentLink2URL: http://documents.rs-components.com/techlib://itc_doclist_GB.htm?stockno=5048928&src-supplier=RSComponents; ComponentLink2Description: http://documents.rs-components.com/techlib://itc_doclist_GB.htm?stockno=5048928&src-supplier=RSComponents; ComponentLink3URL: http://www.yageo.com/documents/recent/PYu-RC0603_51_RoHS_L_4.pdf?src-supplier=Avnet+Europe; ComponentLink3Description: http://www.yageo.com/documents/recent/PYu-RC0603_51_RoHS_L_4.pdf?src-supplier=Avnet+Europe; ComponentLink4URL: http://www.farnell.com/datasheets/2167052.pdf?src-supplier=Element14; ComponentLink4Description: http://www.farnell.com/datasheets/2167052.pdf?src-supplier=Element14; ComponentLink5URL: http://www.farnell.com/datasheets/1868787.pdf?src-supplier=Element14; ComponentLink5Description: http://www.farnell.com/datasheets/1868787.pdf?src-supplier=Element14; ComponentLink6URL: http://www.yageo.com/documents/recent/PYu-RC_Group_51_RoHS_L_2.pdf?src-supplier=Avnet; ComponentLink6Description: http://www.yageo.com/documents/recent/PYu-RC_Group_51_RoHS_L_2.pdf?src-supplier=Avnet; ComponentLink7URL: https://www.verical.com/server-webapp/html/getDatasheet?partID=404327&src-supplier=Verical; ComponentLink7Description: https://www.verical.com/server-webapp/html/getDatasheet?partID=404327&src-supplier=Verical; ComponentLink8URL: http://www.farnell.com/datasheets/443971.pdf?src-supplier=Element14; ComponentLink8Description: http://www.farnell.com/datasheets/443971.pdf?src-supplier=Element14; Supplier Part Number 1: 311-1.00KHRDKR-ND; LCSC Part Number: C22548
R26 = RC0603FR-07130RL: RES 130 OHM 1% 1/10W 0603; Manufacturer: Yageo; Power Rating: 100mW; Temperature Coefficient: 100ppm/°C; Voltage Rating (DC): 50V; Voltage Rating: 75V; Item Type: Resistor; Supplier 1: Future Electronics; Manufacturer Part Number: RC0603FR-07130RL; RoHS: Yes; Category: Chip SMD Resistors; Stock 1: 630000; Pricing 1: 5000=0.0014, 75000=0.0013, 200000=0.0013, 750000=0.0012, 2000000=0.0011 (USD); Case/Package: 0603; Pins: 2; Case Code (Imperial): 0603; Case Code (Metric): 1608; Weight: 7.1E-05oz; Min Operating Temperature: -55°C; Max Operating Temperature: 155°C; Value: 130R; Tolerance: 1%; Packaging: Tape and Reel; Resistor Type: Thick Film; Termination: SMD/SMT; Number of Terminations: 2; Max Power Dissipation: 100mW; Features: Moisture Resistant; Series: RC; Resistance Tolerance: 1%; Construction: Rectangular; Length: 1.6mm; Width: 0.8mm; Height: 0.45mm; Depth: 0.8mm; Lead Free: Lead Free; Reach SVHC Compliant: No; Military Standard: Not; RoHS Compliant: Yes; ComponentLink1URL: https://datasheet.ciiva.com/46395/443971-46395023.pdf?src-supplier=Element14; ComponentLink1Description: https://datasheet.ciiva.com/46395/443971-46395023.pdf?src-supplier=Element14; ComponentLink2URL: https://datasheet.ciiva.com/2553/pyu-r-int-thick-7-2553516.pdf?src-supplier=Digi-Key; ComponentLink2Description: https://datasheet.ciiva.com/2553/pyu-r-int-thick-7-2553516.pdf?src-supplier=Digi-Key; ComponentLink3URL: https://datasheet.ciiva.com/2553/pyu-r-int-thick-7-2553517.pdf?src-supplier=Digi-Key; ComponentLink3Description: https://datasheet.ciiva.com/2553/pyu-r-int-thick-7-2553517.pdf?src-supplier=Digi-Key; ComponentLink4URL: https://datasheet.ciiva.com/2553/pyu-r-int-thick-7-2553515.pdf?src-supplier=Digi-Key; ComponentLink4Description: https://datasheet.ciiva.com/2553/pyu-r-int-thick-7-2553515.pdf?src-supplier=Digi-Key; Supplier Part Number 1: 1846773; LCSC Part Number: C141677
SW1-SW4 = B3U-1000P: SWITCH TACTILE SPST-NO 0.05A 12V; Manufacturer: Omron; Mechanical Life: 200000Cycles; Operating Force: 1.5N; Throw Configuration: SPST; Current Rating: 50mA; Contact Resistance: 100mR; Illumination Type: Non-Illuminated,Illuminated; Switch Travel: 0.15mm; Switch Function: Off-Mom; Actuator Type: Standard; Actuator Length: 0.4mm; Ratings: Dust Proof,IP40; ComponentLink1URL: http://www.farnell.com/datasheets/60838.pdf?src-supplier=Farnell; ComponentLink1Description: http://www.farnell.com/datasheets/60838.pdf?src-supplier=Farnell; ComponentLink2URL: http://www.farnell.com/datasheets/60838.pdf?src-supplier=Element14; ComponentLink2Description: http://www.farnell.com/datasheets/60838.pdf?src-supplier=Element14; ComponentLink3URL: https://omronfs.omron.com/en_US/ecb/products/pdf/en-b3u.pdf?src-supplier=Digi-Key; ComponentLink3Description: https://omronfs.omron.com/en_US/ecb/products/pdf/en-b3u.pdf?src-supplier=Digi-Key; ComponentLink4URL: http://www.omron.com/ecb/products/pdf/en-b3u.pdf?src-supplier=Digi-Key; ComponentLink4Description: http://www.omron.com/ecb/products/pdf/en-b3u.pdf?src-supplier=Digi-Key; ComponentLink5URL: https://www.distrelec.biz/Web/Downloads/he/et/B3U_eng_datasheet.pdf?mime=application%2Fpdf&src-supplier=Distrelec; ComponentLink5Description: https://www.distrelec.biz/Web/Downloads/he/et/B3U_eng_datasheet.pdf?mime=application%2Fpdf&src-supplier=Distrelec; ComponentLink6URL: http://www.onlinecomponents.com/productFiles/mf-OM/en-b3u.pdf?src-supplier=Onlinecomponents.com; ComponentLink6Description: http://www.onlinecomponents.com/productFiles/mf-OM/en-b3u.pdf?src-supplier=Onlinecomponents.com; Supplier 1: Digi-Key; Manufacturer Part Number: B3U-1000P; Stock 1: 116454; Pricing 1: 1=1, 10=0.961, 25=0.9064, 50=0.7976, 100=0.7251, 250=0.68888, 500=0.67074, 1000=0.52571 (USD); Mount: Surface Mount; Weight: 0.000776oz; Contact Material: Silver; Min Operating Temperature: -25°C; Max Operating Temperature: 70°C; Packaging: Tape and Reel; Voltage Rating (DC): 12V; Package Quantity: 1; Max Current Rating: 50mA; Termination: SMD/SMT; Orientation: Straight; Max Voltage Rating (DC): 12V; Electrical Life: 200000Cycles; Insulation Resistance: 100MR; Contact Current Rating: 50mA; Length: 4mm; Height: 1.2mm; Depth: 2.5mm; Width: 3mm; REACH SVHC: Unknown; Lead Free: Lead Free; ComponentLink7URL: https://www.verical.com/server-webapp/html/getDatasheet?partID=552554&src-supplier=Verical; ComponentLink7Description: https://www.verical.com/server-webapp/html/getDatasheet?partID=552554&src-supplier=Verical; ComponentLink8URL: http://www.farnell.com/datasheets/1685550.pdf?src-supplier=Element14; ComponentLink8Description: http://www.farnell.com/datasheets/1685550.pdf?src-supplier=Element14; ComponentLink9URL: http://www.farnell.com/datasheets/2610940.pdf?src-supplier=Farnell; ComponentLink9Description: http://www.farnell.com/datasheets/2610940.pdf?src-supplier=Farnell; ComponentLink10URL: https://www.alliedelec.com/m/d/4c8a9ef82804fc3c241a13c1e298fd73.pdf?src-supplier=Allied+Electronics; ComponentLink10Description: https://www.alliedelec.com/m/d/4c8a9ef82804fc3c241a13c1e298fd73.pdf?src-supplier=Allied+Electronics; Supplier Part Number 1: SW1020DKR-ND; LCSC Part Number: C231329; Item Type: Switch
TP2 = 2 Test Pad: Wire Connecting Pad; Item Type: Test Point; Manufacturer Part Number: 2 Test Pad
TP9 = TEST POINT: Test Point ON; Item Type: TEST POINT
U9 = MIMXRT1062DVJ6B: IC MCU 32BIT EXT MEM 196LFBGA; Manufacturer: NXP Semiconductors; Supplier: Digi-Key; Supplier Part Number: 568-MIMXRT1062DVJ6B-ND; Manufacturer Part Number: MIMXRT1062DVJ6B; RoHS: Yes; Category: Uncategorized; Stock: 1142; Pricing: 1=15.93, 10=12.734, 189=10.75497, 567=10.68896, 945=10.09187 (USD)
U10 = W25Q64JVSSIM: IC FLASH 64MBIT SPI/QUAD 8SOIC; Manufacturer: Winbond; Memory Format: Non-Volatile,FLASH; Memory Size: 64Mb; Frequency: 133MHz; Supplier: Rs; Supplier Part Number: 1882666P; Manufacturer Part Number: W25Q64JVSSIM; RoHS: Yes; Category: Flash; Stock: 300; Pricing: 20=0.818, 50=0.796, 100=0.776, 250=0.756 (GBP); Mounting Technology: Surface Mount; Case/Package: SOIC; Min Operating Temperature: -40°C; Max Operating Temperature: 85°C; Packaging: Rail/Tube; Series: SpiFlash®; RoHS Compliant: Yes; ComponentLink1URL: http://www.winbond.com/resource-files/w25q64jv%20revj%2003272018%20plus.pdf?src-supplier=Digi-Key; ComponentLink1Description: http://www.winbond.com/resource-files/w25q64jv%20revj%2003272018%20plus.pdf?src-supplier=Digi-Key; LCSC Part Number: C5362615; Item Type: IC
U11 = UM803RS: 3-Pin uP Reset Circuits with Ope; Manufacturer: Union Semiconductor; Item Type: IC; Supplier: Arrow Electronics; Supplier Part Number: UM803RS; Manufacturer Part Number: UM803RS; RoHS: No; Stock: 2840; Pricing: 1=0.1121 (USD); LCSC Part Number: C620009
U12 = M24C64-FDW6TP: IC EEPROM 64KBIT I2C 1MHZ 8TSSOP; Manufacturer: STMicroelectronics; Manufacturer Part Number: M24C64-FDW6TP; Package: TSSOP-8; LCSC Part Number: C222148; Item Type: IC; ComponentLink1Description: LCSC; ComponentLink1URL: https://www.lcsc.com/product-detail/EEPROM_STMicroelectronics-M24C64-FDW6TP_C222148.html; Supplier: Digikey; Supplier Part Number: 497-15760-2-ND; RoHS: Yes; Category: EEPROM; Stock: 12000; Pricing: 4000=0.23401, 8000=0.22895, 12000=0.22493, 28000=0.21957 (USD); ComponentLink2URL: https://datasheet.ciiva.com/26942/getdatasheetpartid-785735-26942181.pdf?src-supplier=Verical; ComponentLink2Description: https://datasheet.ciiva.com/26942/getdatasheetpartid-785735-26942181.pdf?src-supplier=Verical; ComponentLink3URL: https://datasheet.ciiva.com/6617/cd00259166-6617416.pdf?src-supplier=Digikey; ComponentLink3Description: https://datasheet.ciiva.com/6617/cd00259166-6617416.pdf?src-supplier=Digikey
U13 = MKL02Z32VFG4: IC MCU 32BIT 32KB FLASH 16QFN; Manufacturer: NXP USA; Supplier: Newark; Supplier Part Number: 49X9712; Manufacturer Part Number: MKL02Z32VFG4; RoHS: No
X2 = X322524MOB4SI: 24MHz SMD Crystal Resonator 12pF ±10ppm ±30ppm -40℃~+85℃ SMD3225-4P Crystals ROHS; Manufacturer: Yangxing Tech; ComponentLink1Description: LCSC; ComponentLink1URL: https://www.lcsc.com/product-detail/Crystals_Yangxing-Tech-X322524MOB4SI_C70590.html; Manufacturer Part Number: X322524MOB4SI; Footprint: Custom; LCSC Part Number: C70590; Item Type: Crystal
X3 = NX3215SA-32.768K-STD-MUA-8: CRYSTAL 32.7680KHZ 12.5PF SMD; Manufacturer: NDK; Frequency: 32.768kHz; Frequency Tolerance: 20ppm; ESR (Equivalent Series Resistance): 70kR; Supplier 1: Digi-Key; Manufacturer Part Number: NX3215SA-32.768K-STD-MUA-8; Stock 1: 29951; Pricing 1: 1=0.68, 10=0.602, 50=0.5628, 100=0.4974, 500=0.47124, 1000=0.3927 (USD); Mount: Surface Mount; Case/Package: SMD/SMT; Number of Pins: 2; Min Operating Temperature: -40°C; Max Operating Temperature: 85°C; Package Quantity: 1000; Load Capacitance: 12.5pF; Packaging: Tape and Reel; Length: 0.126inch; Height: 0.035inch; Width: 0.059inch; Lead Free: Lead Free; ComponentLink1URL: https://media.digikey.com/pdf/Data%20Sheets/NDK%20PDFs/NX3215SA-32.768K-STD-MUA-8.pdf?src-supplier=Digi-Key; ComponentLink1Description: https://media.digikey.com/pdf/Data%20Sheets/NDK%20PDFs/NX3215SA-32.768K-STD-MUA-8.pdf?src-supplier=Digi-Key; ComponentLink2URL: http://www.ndk.com/images/products/catalog/c_NX3215SA-STD-MUA-14_e.pdf?src-supplier=Digi-Key; ComponentLink2Description: http://www.ndk.com/images/products/catalog/c_NX3215SA-STD-MUA-14_e.pdf?src-supplier=Digi-Key; Supplier Part Number 1: 644-1156-6-ND; LCSC Part Number: C156245